# Altium schematic sheet 引出引脚_螺纹孔.schdoc
size 297 x 209 mm; Symbol: Drawing-Symbol_A4; Company: 嘉立创EDA; Version: V1.0; Page Size: A4; @Project Name: RK3566; @Update Date: 2026-10-06; @Create Date: 2026-05-27; Device: Drawing-Symbol_A4; @Board Name: Board1; @Page Name: P2; @Create Time: 12:07:08; @Page Count: 10; @Page No: 0; @Schematic Name: Schematic1; @Update Time: 12:07:08; @Assembly Variant: Basic; Border: 1; Title Block Position: 3; Size: A4; Width: 1170; Height: 825; Region Start: 1; X Region Count: 6; Y Region Count: 4; Blade Width: 10; SheetNumber: 11; SheetTotal: 11
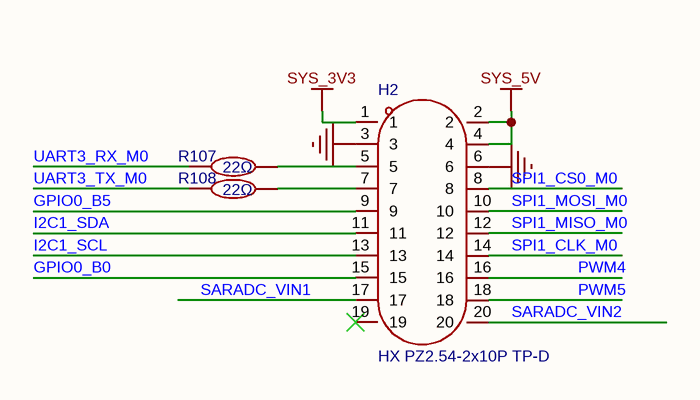
[diagram p0: 引出引脚_螺纹孔.schdoc]

## Parts
H2  HX PZ2.54-2x10P TP-D  [HDR-SMD_20P-P2.54-V-M-R2-C10-S2.54-LS7.5-EH]
R107  22Ω  [R0402]
R108  22Ω  [R0402]

## Nets
GND: H2.3 H2.6
SYS_3V3: H2.1
SYS_5V: H2.2 H2.4
GPIO0_B0: H2.15
GPIO0_B5: H2.9
I2C1_SCL: H2.13
I2C1_SDA: H2.11
PWM4: H2.16
PWM5: H2.18
SARADC_VIN1: H2.17
SARADC_VIN2: H2.20
SPI1_CLK_M0: H2.14
SPI1_CS0_M0: H2.8
SPI1_MISO_M0: H2.12
SPI1_MOSI_M0: H2.10
UART3_RX_M0: R107.1
UART3_TX_M0: R108.1
NetH2_5: H2.5 R107.2
NetH2_7: H2.7 R108.2

Not connected (* = marked no-connect by the designer): H2 19*

## Notes on the sheet
- 创建日期
- 2026-10-06
- 原理图
- 板子
- Schematic1
- Board1
- 更新日期
- 图页
- P2
- 绘制
- 审阅
- RK3566
- 版本
- V1.0
- 尺寸
- A4
- 页    0    共    10
- 嘉立创EDA

## Library data of the parts
H2 = HX PZ2.54-2x10P TP-D: 插针结构:2x10P;间距:2.54mm;行距:2.54mm;圆针/方针:方针;安装方式:立贴;排数:双排;总PIN位数:20P;额定电流:3A;额定电压:1kV;配合针长度:6mm;塑高:2.5mm;端接针长度:-;触头材质:黄铜;触头镀层:金;工作温度:-40℃~+105℃;颜色:黑色;; Manufacturer: hanxia(韩下); AddInBom: yes; ModelId: 2f2e403eed2245bd8cccf105df6707d7聨0819f05c4eef4c71ace90d822a990e87; ModelTransform: 1000.39166,295.275,0,0,0,0,0,0,-27.559; Pin Structure: 2x10P; Pitch: 2.54mm; Circluar Pins/Square Pins: 方针; Current Rating: 3A; Voltage Rating (Max): 1kV; Symbol: HX PZ2.54-2X10P TP-D; Device: HX PZ2.54-2x10P TP-D; LCSC Part Name: 配套排母HX PM2.54-2x10P系列 2x10P 间距:2.54mm 方针 立贴; SupplierPart: C46061674; ManufacturerPart: HX PZ2.54-2x10P TP-D; Supplier Footprint: SMD,P=2.54mm; JLCPCB Part Class: Extended Part; Datasheet: https://item.szlcsc.com/datasheet/HX%2520PZ2.54-2x10P%2520TP-D/48170534.html; Supplier: LCSC; ConvertToPcb: yes; FootprintName: HDR-SMD_20P-P2.54-V-M-R2-C10-S2.54-LS7.5-EH; ModelName: HDR-SMD_20P-P2.54-V-M-R2-C10-S2.54-LS7.5-EH; Row Spacing: 2.54mm; Mounting Type: 立贴; Number of Rows: 双排; Number of Pins: 20P; Length of Mating Pin: 6mm; Insulation Height: 2.5mm; Length of End Connection Pin: -; Contact Material: 黄铜; Contact Plating: 金; Operating Temperature: -40℃~+105℃; Color: 黑色; Supplementary Features: -
R107 R108 = RC0402FR-0722RL: 电阻类型:厚膜电阻;阻值:22Ω;精度:±1%;功率:62.5mW;工作电压:50V;温度系数:±100ppm/℃;; Manufacturer: YAGEO(国巨); 3D Model: 98c88bc2b9094f218f3a3e30a7012738聨0819f05c4eef4c71ace90d822a990e87; 3D Model Transform: 39.37,19.685,0,0,0,0,0,0,0; Tolerance: ±1%; Power(Watts): 62.5mW; Voltage-Supply(Max): 50V; AddInBom: yes; ModelName: R0402_L1.0-W0.5-H0.4; Symbol: RC0402FR-0722RL; Device: RC0402FR-0722RL; LCSC Part Name: 厚膜电阻 22Ω ±1% 62.5mW; Supplier Part: C114765; Manufacturer Part: RC0402FR-0722RL; Supplier Footprint: 0402; JLCPCB Part Class: Extended Part; Datasheet: https://item.szlcsc.com/datasheet/RC0402FR-0722RL/116009.html; Supplier: LCSC; Type: 厚膜电阻; Value: 22Ω; Temperature Coefficient: ±100ppm/℃; Operating Temperature: -55℃~+155℃; ConvertToPcb: yes; FootprintName: R0402